# Altium schematic sheet I2C_Mux_Section.SchDoc
size A4; SheetNumber: 5
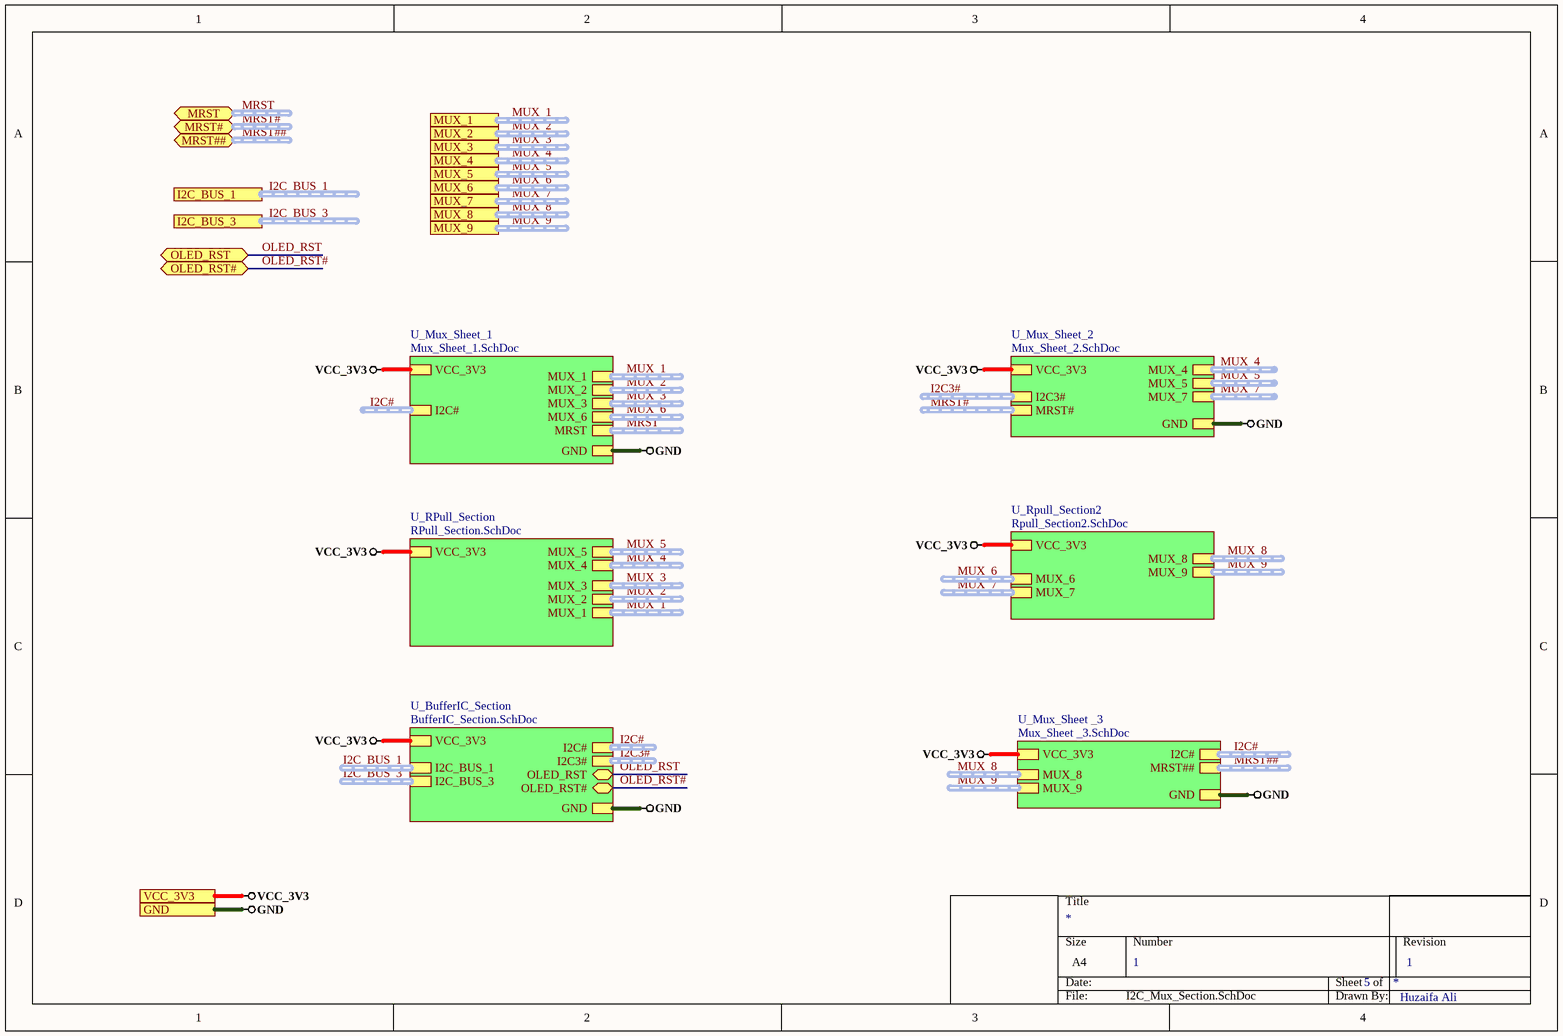
[diagram p0: I2C_Mux_Section.SchDoc]

## Sub-sheets
U_BufferIC_Section = BufferIC_Section.SchDoc: I2C_BUS_1 (harness I2C_BUS_1), I2C_BUS_3 (harness I2C_BUS_3), I2C# (harness I2C#), I2C3# (harness I2C3#), VCC_3V3, GND, OLED_RST (bidir), OLED_RST# (bidir)
U_Mux_Sheet _3 = Mux_Sheet _3.SchDoc: I2C# (harness I2C#), MUX_8 (harness MUX_8), MUX_9 (harness MUX_9), MRST## (harness MRST##), VCC_3V3, GND
U_Mux_Sheet_1 = Mux_Sheet_1.SchDoc: I2C# (harness I2C#), VCC_3V3, GND, MUX_1 (harness MUX_1), MUX_2 (harness MUX_2), MUX_3 (harness MUX_3), MUX_6 (harness MUX_6), MRST (harness MRST)
U_Mux_Sheet_2 = Mux_Sheet_2.SchDoc: VCC_3V3, GND, MUX_4 (harness MUX_4), MUX_5 (harness MUX_5), I2C3# (harness I2C3#), MUX_7 (harness MUX_7), MRST# (harness MRST#)
U_RPull_Section = RPull_Section.SchDoc: MUX_4 (harness MUX_4), MUX_5 (harness MUX_5), MUX_1 (harness MUX_1), MUX_2 (harness MUX_2), MUX_3 (harness MUX_3), VCC_3V3
U_Rpull_Section2 = Rpull_Section2.SchDoc: MUX_7 (harness MUX_7), MUX_8 (harness MUX_8), MUX_9 (harness MUX_9), MUX_6 (harness MUX_6), VCC_3V3

## Ports
GND, I2C_BUS_1 (harness I2C_BUS_1), I2C_BUS_3 (harness I2C_BUS_3), MRST (bidir, harness MRST), MRST# (bidir, harness MRST#), MRST## (bidir, harness MRST##), MUX_1 (harness MUX_1), MUX_2 (harness MUX_2), MUX_3 (harness MUX_3), MUX_4 (harness MUX_4), MUX_5 (harness MUX_5), MUX_6 (harness MUX_6), MUX_7 (harness MUX_7), MUX_8 (harness MUX_8), MUX_9 (harness MUX_9), OLED_RST (bidir), OLED_RST# (bidir), VCC_3V3

## Nets
GND: port GND, sheet U_Mux_Sheet_1/GND, sheet U_Mux_Sheet_2/GND, sheet U_Mux_Sheet _3/GND, sheet U_BufferIC_Section/GND
VCC_3V3: port VCC_3V3, sheet U_Mux_Sheet_1/VCC_3V3, sheet U_Mux_Sheet_2/VCC_3V3, sheet U_RPull_Section/VCC_3V3, sheet U_Rpull_Section2/VCC_3V3, sheet U_Mux_Sheet _3/VCC_3V3, sheet U_BufferIC_Section/VCC_3V3
OLED_RST: port OLED_RST, sheet U_BufferIC_Section/OLED_RST
OLED_RST#: port OLED_RST#, sheet U_BufferIC_Section/OLED_RST#

## Buses and harness runs
harness I2C3# = sheet U_BufferIC_Section/I2C3#
harness I2C3# = sheet U_Mux_Sheet_2/I2C3#
harness I2C# = sheet U_BufferIC_Section/I2C#
harness I2C# = sheet U_Mux_Sheet _3/I2C#
harness I2C# = sheet U_Mux_Sheet_1/I2C#
harness I2C_BUS_1 = port I2C_BUS_1
harness I2C_BUS_1 = sheet U_BufferIC_Section/I2C_BUS_1
harness I2C_BUS_3 = port I2C_BUS_3
harness I2C_BUS_3 = sheet U_BufferIC_Section/I2C_BUS_3
harness MRST = port MRST
harness MRST = sheet U_Mux_Sheet_1/MRST
harness MRST# = port MRST#
harness MRST# = sheet U_Mux_Sheet_2/MRST#
harness MRST## = port MRST##
harness MRST## = sheet U_Mux_Sheet _3/MRST##
harness MUX_1 = port MUX_1
harness MUX_1 = sheet U_Mux_Sheet_1/MUX_1
harness MUX_1 = sheet U_RPull_Section/MUX_1
harness MUX_2 = port MUX_2
harness MUX_2 = sheet U_Mux_Sheet_1/MUX_2
harness MUX_2 = sheet U_RPull_Section/MUX_2
harness MUX_3 = port MUX_3
harness MUX_3 = sheet U_Mux_Sheet_1/MUX_3
harness MUX_3 = sheet U_RPull_Section/MUX_3
harness MUX_4 = port MUX_4
harness MUX_4 = sheet U_Mux_Sheet_2/MUX_4
harness MUX_4 = sheet U_RPull_Section/MUX_4
harness MUX_5 = port MUX_5
harness MUX_5 = sheet U_Mux_Sheet_2/MUX_5
harness MUX_5 = sheet U_RPull_Section/MUX_5
harness MUX_6 = port MUX_6
harness MUX_6 = sheet U_Mux_Sheet_1/MUX_6
harness MUX_6 = sheet U_Rpull_Section2/MUX_6
harness MUX_7 = port MUX_7
harness MUX_7 = sheet U_Mux_Sheet_2/MUX_7
harness MUX_7 = sheet U_Rpull_Section2/MUX_7
harness MUX_8 = port MUX_8
harness MUX_8 = sheet U_Mux_Sheet _3/MUX_8
harness MUX_8 = sheet U_Rpull_Section2/MUX_8
harness MUX_9 = port MUX_9
harness MUX_9 = sheet U_Mux_Sheet _3/MUX_9
harness MUX_9 = sheet U_Rpull_Section2/MUX_9

## Notes on the sheet
- 1
- Huzaifa Ali